# EasyEDA Pro project ProPrj_CactusConKids14_2026-02-14.epro, board CCK14 PCB
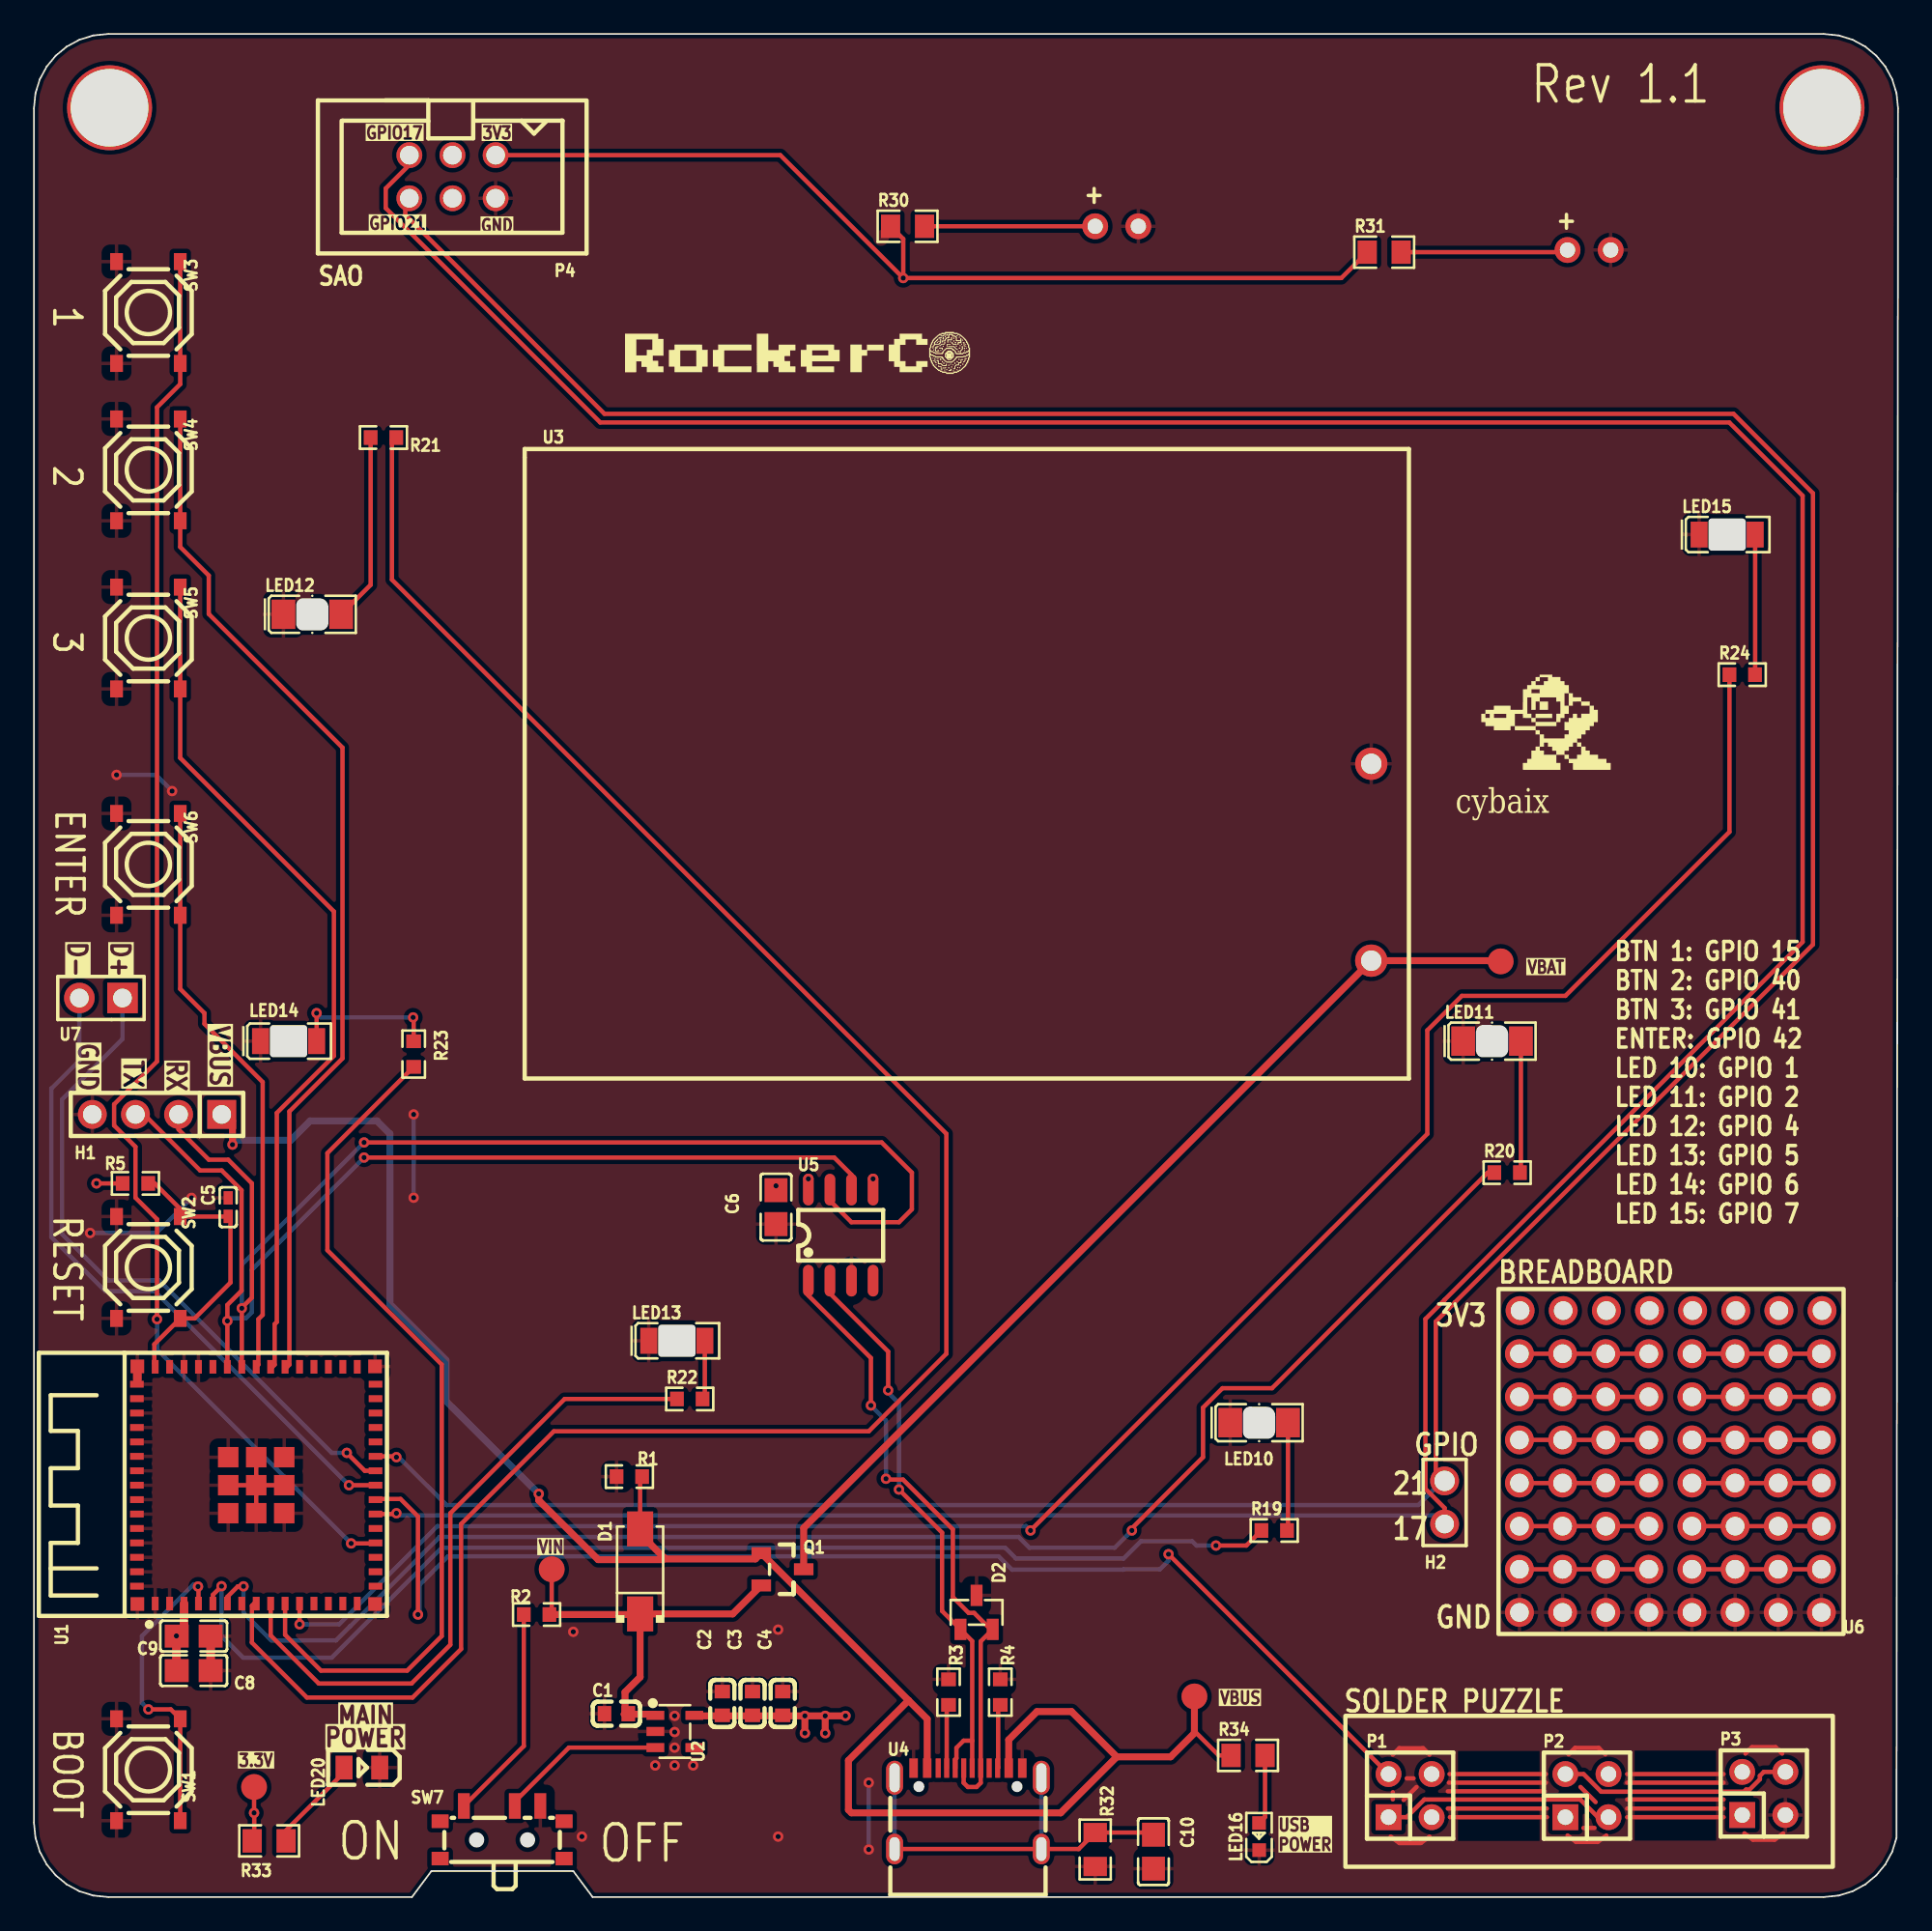
[diagram p5: board, top side]
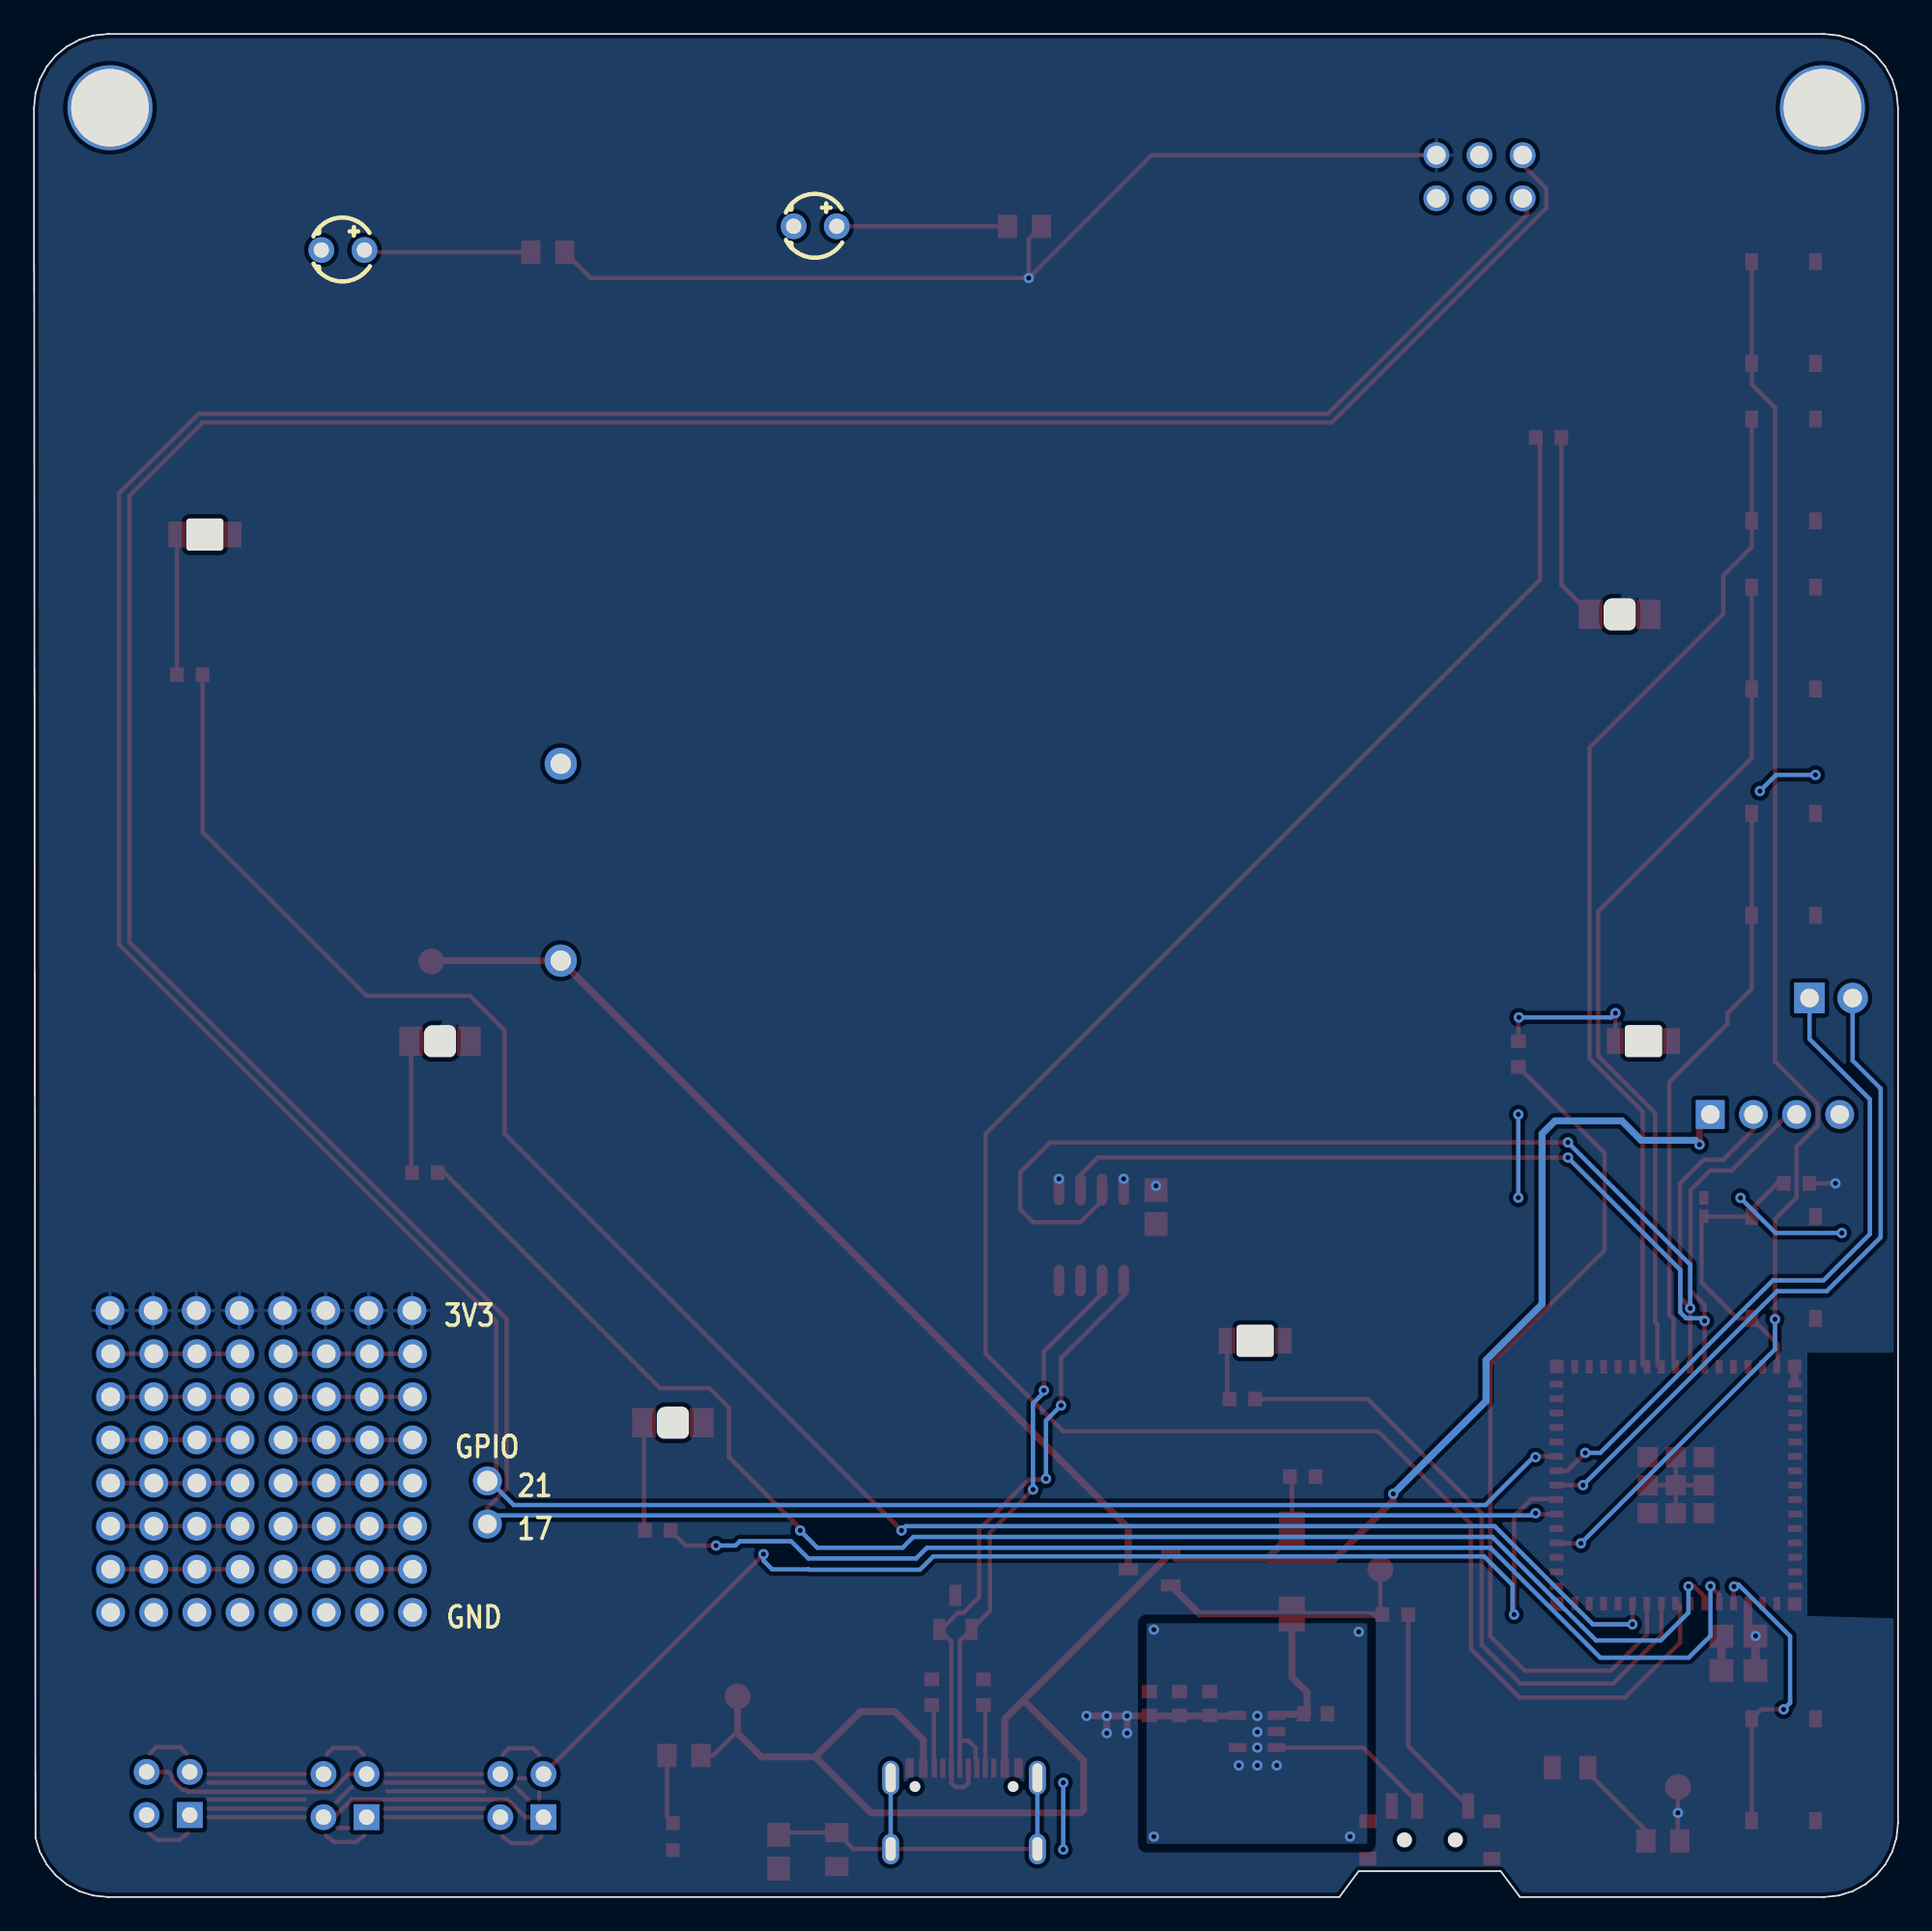
[diagram p6: board, bottom side, seen from below]

Outline 109.77 x 109.76 mm; copper layers: Top Layer, Bottom Layer. Coordinates in mm from the lower left corner of the outline.
Outline path: 0,105.39 0.09,106.27 0.34,107.09 0.75,107.84 1.28,108.48 1.93,109.02 2.67,109.42 3.49,109.67 4.37,109.76 105.39,109.76 106.27,109.67 107.09,109.42 107.84,109.02 108.48,108.48 109.02,107.84 109.42,107.09 109.68,106.27 109.77,105.39 109.68,3.49 109.42,2.67 109.02,1.93 108.48,1.28 107.84,0.75 107.09,0.34 106.27,0.09 105.39,0 32.9,0 31.76,1.53 23.4,1.53 22.26,0 4.37,0 3.49,0.09 2.67,0.34 1.93,0.75 1.28,1.28 0.75,1.93 0.34,2.67 0.09,3.49 0,4.37 0,105.39
Stack: Top Layer 0.035mm / Dielectric1 1.51mm FR4 er 4.5 / Bottom Layer 0.035mm

## Design rules (mm)
template: Custom Config
spacing copperThickness1oz (default): track to track 0.102, other pairs 0.152 to 0.3
spacing copperThickness2oz: track to track 0.203, other pairs 0.152 to 0.3
track width copperThickness1oz (default): min 0.127, default 0.254, max 2.54
track width copperThickness2oz: min 0.203, default 0.254, max 2.54
differential pair differentialPair (default): width min 0.127, default 0.254, max 2.54; gap min 0.152, default 0.152
via viaSize (default): diameter min 0.5, default 0.61, max 10; hole min 0.3, default 0.305, max 6.3
pour e24442 uses copperRegion1

## Placement (name value [footprint] x y rotation side)
C1  10uF  [C0603]  34.3 10.8 0 top
C2  10uF  [C0603]  40.53 11.41 270 top
C3  10uF  [C0603]  42.31 11.41 270 top
C4  10uF  [C0603]  44.09 11.41 270 top
C5  1uF  [C0402]  11.44 40.65 90 top
C6  100nF  [C0805]  43.69 40.65 270 top
C8  4.7uF  [C0805]  9.4 13.34 0 top
C9  100nF  [C0805]  9.4 15.37 0 top
C10  100nF  [C0805]  65.92 2.67 90 top
D1  SK54A-LTP  [SMA_L4.4-W2.8-LS5.4-R-RD]  35.69 19.18 90 top
D2  PESD2USB3UV-TR  [SOT-23-3_L2.9-W1.3-P0.95-LS2.4-BR]  55.51 16.77 270 top
H1  PZ254V-11-04P  [HDR-TH_4P-P2.54-V-M]  7.25 46.11 180 top
H2  PZ254V-11-02P  [HDR-TH_2P-P2.54-V-M]  83.06 23.25 90 top
LED7  TZ-L2-03YYBR2RDJ30-003  [LED-TH_BD3.8-P2.54-RD]  63.76 98.43 180 bottom
LED8  TZ-L2-03YYBR2RDJ30-003  [LED-TH_BD3.8-P2.54-RD]  91.57 97.03 180 bottom
LED10  LTST-C21KRKT  [LED-SMD_L3.2-W1.6-RD-EH_RED]  72.14 27.95 0 top
LED11  LTST-C21KRKT  [LED-SMD_L3.2-W1.6-RD-EH_RED]  85.86 50.43 0 top
LED12  LTST-C21KRKT  [LED-SMD_L3.2-W1.6-RD-EH_RED]  16.39 75.57 0 top
LED13  LTST-C230TBKT  [LED1206-RD_BLUE_LTST-C230TBKT]  37.85 32.77 0 top
LED14  LTST-C230TBKT  [LED1206-RD_BLUE_LTST-C230TBKT]  14.99 50.43 0 top
LED15  LTST-C230TBKT  [LED1206-RD_BLUE_LTST-C230TBKT]  99.7 80.27 0 top
LED16  XL-1608SURC-06  [LED0603-RD_RED]  72.14 3.56 90 top
LED20  KT-0805G  [LED0805-R-RD]  19.31 7.63 180 top
NOREF  -  [Pad_e12518]  30.49 19.31 0 top
NOREF#2  -  [Pad_e8885]  4.45 105.42 0 top
NOREF#3  -  [Pad_e9634]  105.29 105.42 0 top
NOREF#4  -  [Pad_e10780]  68.33 11.82 0 top
NOREF#5  -  [Pad_e10976]  86.37 55.12 0 top
NOREF#6  -  [Pad_e11363]  12.96 6.48 0 top
P1  2.54-2*2P针  [HDR-TH_4P-P2.54-V-M-R2-C2-S2.54-1]  81.03 5.98 0 top
P2  2.54-2*2P针  [HDR-TH_4P-P2.54-V-M-R2-C2-S2.54-1]  91.45 5.98 0 top
P3  2.54-2*2P针  [HDR-TH_4P-P2.54-V-M-R2-C2-S2.54-1]  101.86 6.1 0 top
P4  2.54-2*3P简牛  [IDC-TH_6P-P2.54_C11214]  24.64 101.35 180 top
Q1  DMP2045U-7  [SOT-23-3_L2.9-W1.3-P1.90-LS2.4-BR-CW]  44.08 19.31 180 top
R1  100kΩ  [R0603]  35.06 24.77 180 top
R2  100kΩ  [R0603]  29.6 16.64 180 top
R3  5.1kΩ  [R0603]  53.85 12.07 270 top
R4  5.1kΩ  [R0603]  56.9 12.07 270 top
R5  5.1kΩ  [R0603]  5.98 42.04 180 top
R19  150Ω  [R0603]  73.03 21.6 0 top
R20  150Ω  [R0603]  86.75 42.68 0 top
R21  150Ω  [R0603]  20.58 85.99 180 top
R22  150Ω  [R0603]  38.61 29.34 0 top
R23  150Ω  [R0603]  22.36 49.66 90 top
R24  150Ω  [R0603]  100.59 72.02 0 top
R30  150Ω  [R0805]  51.44 98.43 0 top
R31  150Ω  [R0805]  79.51 96.91 0 top
R32  1MΩ  [R0805]  62.49 2.8 270 top
R33  360Ω  [R0805]  13.85 3.31 0 top
R34  360Ω  [R0805]  71.49 8.35 0 top
SW1  TS-1187A-B-A-B  [SW-SMD_4P-L5.1-W5.1-P3.70-LS6.5-TL_H1.5]  6.74 7.5 270 top
SW2  TS-1187A-B-A-B  [SW-SMD_4P-L5.1-W5.1-P3.70-LS6.5-TL_H1.5]  6.74 37.09 270 top
SW3  TS-1187A-B-A-B  [SW-SMD_4P-L5.1-W5.1-P3.70-LS6.5-TL_H1.5]  6.74 93.35 270 top
SW4  TS-1187A-B-A-B  [SW-SMD_4P-L5.1-W5.1-P3.70-LS6.5-TL_H1.5]  6.74 84.08 270 top
SW5  TS-1187A-B-A-B  [SW-SMD_4P-L5.1-W5.1-P3.70-LS6.5-TL_H1.5]  6.74 74.17 270 top
SW6  TS-1187A-B-A-B  [SW-SMD_4P-L5.1-W5.1-P3.70-LS6.5-TL_H1.5]  6.74 60.84 270 top
SW7  SSSS811101  [SW-SMD_SSSS811101]  27.57 3.82 0 top
U1  2.4GHz  [BULETM-SMD_ESP32-S3-MINI-1-N8]  13.09 24.26 90 top
U2  RT9080-33GJ5  [TSOT-23-5_L2.9-W1.6-P0.95-LS2.8-BL]  37.74 9.76 270 top
U3  BH-AAA-A1AJ024  [BAT-TH_BH-AAA-A1AJ024]  78.75 60.97 0 top
U4  HX TYPE-C 16PIN  [TYPE-C-SMD_HX-TYPE-C-16PIN]  55 5.21 0 top
U5  CH340N  [SOP-8_L4.9-W3.9-P1.27-LS6.0-BL]  47.5 39 0 top
U6  -  [Breadboard 8x8 3V3]  106.31 35.57 180 top
U7  PZ2.54-1*2  [HDR-TH_2P-P2.54-V-M-3]  3.94 52.97 180 top

## Footprints (pads in the part's own frame, mm; a bottom-side part is the same pattern mirrored in y, then rotated)
BAT-TH_BH-AAA-A1AJ024
  round 1.9 hole 1.2: 1(0,5.8) 2(0,-5.8)
Breadboard 8x8 3V3
  round 1.7 hole 1.1: 1(1.016,1.016) 2(3.556,1.016) 3(6.096,1.016) 4(8.636,1.016) 5(11.176,1.016) 6(13.716,1.016) 7(16.256,1.016) 8(18.796,1.016) 9(1.054,3.556) 10(3.594,3.556) 11(6.134,3.556) 12(8.674,3.556) 13(11.214,3.556) 14(13.754,3.556) 15(16.294,3.556) 16(18.834,3.556) 17(1.054,6.096) 18(3.594,6.096) 19(6.134,6.096) 20(8.674,6.096) 21(11.214,6.096) 22(13.754,6.096) 23(16.294,6.096) 24(18.834,6.096) 25(1.054,8.636) 26(3.594,8.636) 27(6.134,8.636) 28(8.674,8.636) 29(11.214,8.636) 30(13.754,8.636) 31(16.294,8.636) 32(18.834,8.636) 33(1.054,11.176) 34(3.594,11.176) 35(6.134,11.176) 36(8.674,11.176) 37(11.214,11.176) 38(13.754,11.176) 39(16.294,11.176) 40(18.834,11.176) 41(1.054,13.716) 42(3.594,13.716) 43(6.134,13.716) 44(8.674,13.716) 45(11.214,13.716) 46(13.754,13.716) 47(16.294,13.716) 48(18.834,13.716) 49(1.054,16.256) 50(3.594,16.256) 51(6.134,16.256) 52(8.674,16.256) 53(11.214,16.256) 54(13.754,16.256) 55(16.294,16.256) 56(18.834,16.256) 57(1.054,18.796) 58(3.594,18.796) 59(6.134,18.796) 60(8.674,18.796) 61(11.214,18.796) 62(13.754,18.796) 63(16.294,18.796) 64(18.834,18.796)
BULETM-SMD_ESP32-S3-MINI-1-N8
  rect 0.8x0.4 smd: 1(-6.975,5.95) 2(-6.975,5.1) 3(-6.975,4.25) 4(-6.975,3.4) 5(-6.975,2.55) 6(-6.975,1.7) 7(-6.975,0.85) 8(-6.975,0) 9(-6.975,-0.85) 10(-6.975,-1.7) 11(-6.975,-2.55) 12(-6.975,-3.4) 13(-6.975,-4.25) 14(-6.975,-5.1) 15(-6.975,-5.95) 31(6.975,-5.95) 32(6.975,-5.1) 33(6.975,-4.25) 34(6.975,-3.4) 35(6.975,-2.55) 36(6.975,-1.7) 37(6.975,-0.85) 38(6.975,0) 39(6.975,0.85) 40(6.975,1.7) 41(6.975,2.55) 42(6.975,3.4) 43(6.975,4.25) 44(6.975,5.1) 45(6.975,5.95)
  rect 0.4x0.8 smd: 16(-5.95,-7.025) 17(-5.1,-7.025) 18(-4.25,-7.025) 19(-3.4,-7.025) 20(-2.55,-7.025) 21(-1.7,-7.025) 22(-0.85,-7.025) 23(0,-7.025) 24(0.85,-7.025) 25(1.7,-7.025) 26(2.55,-7.025) 27(3.4,-7.025) 28(4.25,-7.025) 29(5.1,-7.025) 30(5.95,-7.025) 46(5.95,7.025) 47(5.1,7.025) 48(4.25,7.025) 49(3.4,7.025) 50(2.55,7.025) 51(1.7,7.025) 52(0.85,7.025) 53(0,7.025) 54(-0.85,7.025) 55(-1.7,7.025) 56(-2.55,7.025) 57(-3.4,7.025) 58(-4.25,7.025) 59(-5.1,7.025) 60(-5.95,7.025)
  rect 0.8x0.8 smd: GND(-7,7) GND(-7,-7) GND(7,7) GND(7,-7)
  rect 1.2x1.2 smd: GND(-1.65,1.65) GND(-1.65,0) GND(-1.65,-1.65) GND(0,1.65) GND(0,0) GND(0,-1.65) GND(1.65,1.65) GND(1.65,0) GND(1.65,-1.65)
C0402
  rect 0.79x0.54 smd: 1(-0.545,0) 2(0.545,0)
C0603
  rect 0.8x0.9 smd: 1(-0.7,0) 2(0.7,0)
C0805
  rect 1.41x1.35 smd: 1(-1,0) 2(1,0)
HDR-TH_2P-P2.54-V-M
  round 1.7 hole 1.1: 1(-1.27,0)
  round 1.7 hole 1.2x1.1: 2(1.27,0)
HDR-TH_2P-P2.54-V-M-3
  rect 1.8x1.8 hole 1.1: 1(-1.27,0)
  round 1.8 hole 1.1: 2(1.27,0)
HDR-TH_4P-P2.54-V-M
  rect 1.7x1.7 hole 1.1: 1(-3.81,0)
  round 1.7 hole 1.1: 2(-1.27,0) 3(1.27,0) 4(3.81,0)
HDR-TH_4P-P2.54-V-M-R2-C2-S2.54-1
  rect 1.524x1.524 hole 0.914: 1(-1.27,-1.27)
  round 1.524 hole 0.914: 2(-1.27,1.27) 3(1.27,-1.27) 4(1.27,1.27)
IDC-TH_6P-P2.54_C11214
  round 1.524 hole 1.1: 1(-2.54,-1.27) 2(-2.54,1.27) 3(0,-1.27) 4(0,1.27) 5(2.54,-1.27) 6(2.54,1.27)
LED0603-RD_RED
  rect 0.8x0.8 smd: 1(-0.799,-0.004) 2(0.799,0.004)
LED0805-R-RD
  rect 1x1.399 smd: 1(1.05,0) 2(-1.05,0)
LED1206-RD_BLUE_LTST-C230TBKT
  rect 1x1.524 smd: 1(-1.651,0) 2(1.651,0)
LED-SMD_L3.2-W1.6-RD-EH_RED
  rect 1.4x1.728 smd: 1(-1.7,0) 2(1.7,0)
LED-TH_BD3.8-P2.54-RD
  round 1.524 hole 0.9: 1(-1.27,0) 2(1.27,0)
Pad_e8885
  round 5.004 hole 4.572: (0,0)
Pad_e9634
  round 5.004 hole 4.572: (0,0)
Pad_e10780
  round 1.524 smd: 1(0,0)
Pad_e10976
  round 1.524 smd: 1(0,0)
Pad_e11363
  round 1.524 smd: 1(0,0)
Pad_e12518
  round 1.524 smd: 1(0,0)
R0603
  rect 0.806x0.864 smd: 1(-0.753,0) 2(0.753,0)
R0805
  rect 1.133x1.377 smd: 1(-1,0) 2(1,0)
SMA_L4.4-W2.8-LS5.4-R-RD
  rect 2.062x1.539 smd: 1(2.503,0) 2(-2.503,0)
SOP-8_L4.9-W3.9-P1.27-LS6.0-BL
  oval 0.63x1.865 smd: 1(-1.905,-2.683) 2(-0.635,-2.683) 3(0.635,-2.683) 4(1.905,-2.683) 5(1.905,2.683) 6(0.635,2.683) 7(-0.635,2.683) 8(-1.905,2.683)
SOT-23-3_L2.9-W1.3-P0.95-LS2.4-BR
  rect 1.25x0.7 smd: 1(1,-0.95) 2(1,0.95) 3(-1,0)
SOT-23-3_L2.9-W1.3-P1.90-LS2.4-BR-CW
  rect 1.15x0.7 smd: 1(1.25,-0.95) 2(-1.25,0) 3(1.25,0.95)
SW-SMD_4P-L5.1-W5.1-P3.70-LS6.5-TL_H1.5
  rect 1x0.75 smd: 1(-3,1.875) 2(3,1.875) 3(-3,-1.875) 4(3,-1.875)
SW-SMD_SSSS811101
  rect 0.7x1.5 smd: 1(-2.25,1.55) 2(0.75,1.55) 3(2.25,1.55)
  rect 1x0.8 smd: 4(-3.65,0.65) 5(3.65,0.65) 6(3.65,-1.55) 7(-3.65,-1.55)
TSOT-23-5_L2.9-W1.6-P0.95-LS2.8-BL
  rect 0.532x1.045 smd: 1(-0.95,-1.147) 2(0,-1.147) 3(0.95,-1.147) 4(0.95,1.147) 5(-0.95,1.147)
TYPE-C-SMD_HX-TYPE-C-16PIN
  oval 1x2 hole 0.6x1.7: 17(-4.32,1.816) 20(4.32,1.816)
  oval 1x1.8 hole 0.6x1.4: 18(-4.32,-2.384) 19(4.32,-2.384)
  rect 0.3x1.14 smd: A5(-1.25,2.383) A6(-0.25,2.383) A7(0.25,2.383) A8(1.25,2.384) B5(1.75,2.383) B6(0.75,2.383) B7(-0.75,2.383) B8(-1.75,2.384)
  rect 0.5x1.14 smd: A9B4(2.4,2.384) A12B1(3.2,2.384) B9A4(-2.4,2.384) B12A1(-3.2,2.384)

## Nets
As in the schematic, except:
3.3V: C2.2 C3.2 C4.2 C6.1 C8.1 C9.1 NOREF#6.1 P4.1 R5.2 R30.1 R31.1 R33.1 U1.3 U2.5 U5.5 U5.8 U6.1 U6.2 U6.3 U6.4 U6.5 U6.6 U6.7 U6.8
VBAT: NOREF#5.1 Q1.2 U3.2
VBUS: D1.1 H1.1 NOREF#4.1 Q1.1 R1.1 R34.1 U4.A9B4 U4.B9A4
VIN: C1.2 D1.2 NOREF.1 Q1.3 R2.1 U2.1

Pads without a net: P1 3 4; P2 1 4; P3 1 2; P4 3 4; SW7 4 5 6 7; U1 7 12 13 14 15 16 17 18 20 26 27 28 29 30 31 32 33 34 35 41 44; U2 4; U4 A8 B8; U5 4

## Via types
v1: diameter 0.61, hole 0.305, Top Layer to Bottom Layer, 58 vias

## Routing (per net, layer and track width the routed paths; a pad name or vN(x,y) marks a point on that pad's centre or on a via; arc(x,y) is an arc through that point)
3.3V: length 77.5
  Top Layer w0.254: R30.1 51.19,97.69 v1(51.19,95.38) ; NOREF#6.1 v1(12.96,4.96) 12.97,4.95 12.97,3.56 ; v1(3.68,42.04) R5.2 ; P4.1 43.95,102.62 v1(51.19,95.38) ; v1(51.19,95.38) 76.98,95.38 R31.1
  Top Layer w0.406: v1(45.4,10.67) v1(45.4,9.66) ; v1(45.4,10.67) v1(46.59,10.67) ; v1(45.4,10.67) 38.92,10.67 U2.5 ; v1(46.59,10.67) v1(46.59,9.65) ; v1(46.59,10.67) v1(47.79,10.67)
  Top Layer w0.508: 8.53,13.72 8.39,13.87 v1(8.39,15.39) 8.84,15.84 U1.3
  vias: v1(43.69,41.9) v1(45.6,42.31) v1(49.41,42.31)
GND: length 103.4
  Top Layer w0.254: 79.89,3.56 80.4,3.18 81.67,3.18 82.18,3.56 ; 80.02,8.39 80.4,8.77 81.79,8.77 82.18,8.39 ; 80.02,6.17 80.02,5.76 ; 80.65,5.72 81.41,6.48 ; 80.83,6.99 81.23,6.99 ; 83.26,6.23 88.97,6.23 ; 83.26,5.21 89.08,5.21 ; 83.32,6.74 89.03,6.74 ; 83.36,7.25 89.03,7.25 ; 83.38,4.71 89.09,4.71 ; 90.3,3.63 90.81,3.25 92.08,3.25 92.59,3.63 ; 90.37,8.41 90.75,8.79 92.14,8.79 92.53,8.41 ; 91.89,4.07 91.24,4.07 ; 93.82,7.25 99.49,7.25 ; 93.82,6.74 99.49,6.74 ; 93.82,5.75 99.49,5.75 ; 93.82,5.21 99.49,5.21 ; 93.82,4.71 99.49,4.71 ; 100.72,3.75 101.23,3.37 102.5,3.37 103,3.75 ; 100.78,8.45 101.16,8.83 102.56,8.83 102.94,8.45 ; U1.GND U1.GND ; U1.GND U1.GND ; U1.GND U1.GND ; U1.GND U1.GND
  Top Layer w0.508: 6.09,30.49 U1.GND ; C9.2 C8.2
  Bottom Layer w0.254: v1(9.28,41.19) 7.21,39.12 v1(3.31,39.12) ; v1(8.13,65.16) 7.18,66.11 v1(4.86,66.11) ; v1(22.36,46.11) v1(22.36,41.2) ; v1(49.16,6.74) v1(49.16,2.8)
  vias: v1(31.76,15.63) v1(32.26,3.56) v1(36.58,7.75) v1(37.73,10.67) v1(37.73,9.72) v1(37.73,8.8) v1(37.73,7.75) v1(38.82,7.75) v1(43.82,15.75) v1(43.82,3.56)
VBAT: length 57.4
  Top Layer w0.406: NOREF#5.1 86.37,55.17 U3.2 45.33,21.75 Q1.2
VBUS: length 119.7
  Top Layer w0.254: D1.1 35.69,24.65 R1.1 ; R34.1 69.77,8.35 68.33,9.78
  Top Layer w0.406: v1(29.72,23.76) 29.72,23.38 33.22,19.88 37.02,19.88 37.12,19.98 ; 51.5,11.59 47.96,8.05 47.96,5.14 48.14,4.96 60.46,4.96 63.76,8.26 ; 51.5,11.59 52.6,10.49 U4.B9A4 ; 51.5,11.59 Q1.1 42.49,19.92 37.12,19.92 37.12,19.98 ; 11.06,46.36 11.69,45.73 v1(11.69,44.33) ; U4.A9B4 57.4,9.26 59.06,10.93 61.09,10.93 63.76,8.26 ; NOREF#4.1 68.33,9.66 66.94,8.26 63.76,8.26 ; 37.12,19.98 35.69,21.4 D1.1
  Bottom Layer w0.406: v1(29.72,23.76) 24.26,29.22 24.26,31.63 20.96,34.93 20.96,44.96 20.2,45.73 16.26,45.73 15.12,44.58 11.94,44.58 v1(11.69,44.33)
VIN: length 24.1
  Top Layer w0.254: NOREF.1 30.49,16.78 R2.1
  Top Layer w0.406: R2.1 35.66,16.64 D1.2 ; D1.2 35.69,12.96 34.8,12.07 34.8,10.82 34.76,10.77 36.53,10.77 U2.1 ; D1.2 41.14,16.68 Q1.3
BOOT: length 18.2
  Top Layer w0.254: U1.4 9.69,18.27 v1(9.66,18.29) ; v1(6.74,11.06) 8.06,11.06 SW1.1 SW1.2
  Bottom Layer w0.254: v1(9.66,18.29) 9.53,18.42 9.4,18.42 6.36,15.37 6.36,11.44 v1(6.74,11.06)
BUTTON1: length 84.4
  Top Layer w0.254: v1(7.25,34.04) 7.25,39.93 5.98,41.2 5.98,44.2 4.72,45.46 4.72,46.7 7.25,49.23 7.25,87.76 8.61,89.13 SW3.2 SW3.1 ; U1.19 20.08,20.84 v1(18.68,20.84)
  Bottom Layer w0.254: v1(18.68,20.84) 7.25,32.27 v1(7.25,34.04)
BUTTON2: length 61.3
  Top Layer w0.254: SW4.1 SW4.2 8.61,79.54 10.29,77.86 10.29,75.59 18.17,67.72 18.17,49.41 15.04,46.28 15.04,31.37 14.91,31.24 14.79,31.24
BUTTON3: length 51.3
  Top Layer w0.254: 13.94,31.24 14.05,31.24 14.17,31.37 14.17,33.75 14.3,33.88 14.3,46.2 17.66,49.56 17.66,58.06 8.61,67.11 SW5.1
BUTTON4: length 34.8
  Top Layer w0.254: 13.09,31.24 13.21,31.37 13.21,34.04 13.47,34.3 13.47,48.01 10.04,51.44 10.04,52.07 8.61,53.5 SW6.2 SW6.1
CC1: length 3.8
  Top Layer w0.254: U4.A5 53.75,11.21 R3.2
CC2: length 3.8
  Top Layer w0.254: U4.B5 56.78,7.62 56.78,11.19 R4.2
D+: length 37.3
  Top Layer w0.254: v1(50.17,24.64) 50.22,24.59 51.18,24.59 54.11,21.66 54.11,17.67 55.04,16.74 55.36,16.74 56.33,15.77 D2.2 55.75,15.06 U4.B6 55.75,6.73 55.5,6.48 54.99,6.48 54.74,6.73 54.74,7.59 U4.A6 ; U5.1 45.6,35.44 49.28,31.76 v1(49.28,28.96)
  Bottom Layer w0.254: v1(49.28,28.96) 50.17,28.07 v1(50.17,24.64)
D-: length 34.5
  Top Layer w0.254: v1(50.3,29.85) 50.3,32.14 46.87,35.57 U5.2 ; 55.25,9.21 U4.A7 ; 55.25,9.21 55.25,15.08 D2.1 53.47,16.85 53.47,21.47 v1(50.93,24.01) ; 55.25,9.21 54.74,9.21 54.32,8.79 54.32,8.18 54.25,8.1 U4.B7
  Bottom Layer w0.254: v1(50.3,29.85) 50.3,29.72 50.93,29.09 v1(50.93,24.01)
EN: length 9.8
  Top Layer w0.254: U2.3 31.5,8.81 28.32,5.62 28.32,5.37
GPIO17: length 227.6
  Top Layer w0.254: H2.1 83.06,22.92 81.94,24.05 81.94,34.05 83.06,35.18 83.06,35.19 104.15,56.27 104.15,82.56 99.83,86.88 33.34,86.88 20.71,99.5 20.71,100.66 22.1,102.05 P4.5 ; U1.21 21.29,22.56 v1(21.34,22.61)
  Bottom Layer w0.254: H2.1 82.56,22.49 21.47,22.49 v1(21.34,22.61)
GPIO18: length 74.6
  Top Layer w0.254: U1.22 20.15,23.45 21.58,23.45 22.61,22.42 v1(22.61,16.64) ; v1(66.81,20.2) P1.2
  Bottom Layer w0.254: v1(22.61,16.64) 22.7,16.73 22.7,18.39 24.38,20.07 56.81,20.07 57.59,19.28 64.13,19.28 64.16,19.31 66.3,19.31 66.81,19.82 v1(66.81,20.2)
GPIO21: length 223.1
  Top Layer w0.254: v1(21.34,25.91) 21.29,25.96 U1.25 ; P4.6 22.1,99.94 21.86,99.7 21.86,99.11 33.59,87.38 100.08,87.38 104.76,82.7 104.76,56.12 83.67,35.04 83.67,35.03 82.55,33.91 82.55,25.04 H2.2
  Bottom Layer w0.254: H2.2 82.94,24.52 81.52,23.1 24.29,23.1 21.47,25.91 v1(21.34,25.91)
LED1: length 69.8
  Top Layer w0.254: R19.1 71.39,20.71 v1(69.6,20.71) ; U1.5 10.54,17.81 v1(11.04,18.31)
  Bottom Layer w0.254: v1(11.04,18.31) 11.04,15.38 12.33,14.1 17.53,14.1 24.01,20.58 57.18,20.58 57.82,19.95 64.16,19.95 65.18,20.96 68.21,20.96 68.46,20.71 v1(69.6,20.71)
LED2: length 91.2
  Top Layer w0.254: v1(12.34,18.31) 12.01,18.31 11.39,17.69 U1.6 ; v1(64.65,21.6) 64.65,21.72 68.84,25.91 68.84,28.84 69.98,29.98 72.9,29.98 85.6,42.68 R20.1
  Bottom Layer w0.254: v1(12.34,18.31) 12.34,16.76 13.98,15.12 17.78,15.12 18.61,15.94 18.61,15.94 23.88,21.22 57.98,21.22 58.62,20.58 63.63,20.58 v1(64.65,21.6)
LED3: length 125.1
  Top Layer w0.254: U1.8 12.96,17.29 12.83,17.16 12.83,14.99 16.07,11.75 22.3,11.75 25.15,14.61 25.15,21.98 30.61,27.44 49.16,27.44 53.73,32.01 53.73,44.96 21.08,77.61 21.08,85.86 21.21,85.99 R21.1
LED4: length 38.5
  Top Layer w0.254: U1.9 13.94,15.41 16.77,12.58 22.23,12.58 24.52,14.87 24.52,22.61 31.25,29.34 R22.1
LED5: length 51.2
  Top Layer w0.254: R23.1 17.28,43.83 17.28,38.11 24.01,31.38 24.01,15.37 21.98,13.34 16.9,13.34 14.79,15.45 U1.10
LED6: length 117.8
  Top Layer w0.254: R24.1 99.84,62.75 90.18,53.09 84.08,53.09 82.05,51.06 82.05,44.96 v1(58.68,21.6) ; U1.11 15.64,16.07 v1(15.64,16.07)
  Bottom Layer w0.254: v1(58.68,21.6) 58.43,21.85 23.76,21.85 17.98,16.07 v1(15.64,16.07)
RESET: length 17
  Top Layer w0.254: R5.1 7.11,42.04 8.61,40.54 SW2.1 11.43,40.09 C5.1 11.57,39.97 11.57,36.2 9.46,34.09 SW2.2 7.09,32.57 7.09,31.41 7.14,31.37
RX: length 72.1
  Top Layer w0.254: 8.52,46.36 8.52,45.22 10.29,43.44 11.44,43.44 12.83,42.04 12.83,35.31 12.36,34.84 12.36,34.81 v1(12.24,34.69) 12.24,31.24 ; U5.7 46.87,41.03 48.14,39.76 50.93,39.76 51.7,40.52 51.7,42.68 49.92,44.46 v1(19.44,44.46)
  Bottom Layer w0.254: v1(12.24,34.69) 12.24,37.26 v1(19.44,44.46)
S3_D+: length 39.6
  Top Layer w0.254: v1(18.42,26.17) 19.48,25.11 U1.24
  Bottom Layer w0.254: v1(18.42,26.17) 17.53,26.17 7.37,36.33 4.39,36.33 1.66,39.06 1.66,47 5.21,50.55 U7.1
S3_D-: length 39.9
  Top Layer w0.254: v1(18.55,24.26) U1.23
  Bottom Layer w0.254: v1(18.55,24.26) 7.12,35.69 4.2,35.69 1.02,38.87 1.02,47.63 2.67,49.28 U7.2
TX: length 62.5
  Top Layer w0.254: U5.6 48.14,42.55 47.12,43.57 v1(19.44,43.57) ; 11.39,31.24 v1(11.39,33.94) 11.39,34.88 12.22,35.72 12.22,41.64 11.06,42.81 9.79,42.81 6.74,45.85 6.48,45.85 5.98,46.36
  Bottom Layer w0.254: v1(11.39,33.94) 11.55,34.1 12.48,34.1 12.82,34.45 12.82,36.95 v1(19.44,43.57)
$1N5519: length 12.7
  Top Layer w0.254: 25.32,5.37 28.84,8.9 R2.2
$1N10299: length 24.1
  Top Layer w0.254: C10.2 65.79,3.8 R32.1 61.52,2.83 U4.19 U4.18
  Bottom Layer w0.254: U4.17 U4.18 ; U4.20 U4.19
$2N3582: length 10
  Top Layer w0.254: R30.2 LED7.2
$2N3586: length 9.8
  Top Layer w0.254: LED8.2 90.18,96.91 R31.2
$2N10665: length 6.4
  Top Layer w0.254: R19.2 73.84,21.65 LED10.2
$2N10669: length 7.8
  Top Layer w0.254: 87.37,42.68 87.56,42.86 LED11.2
$2N10674: length 11.1
  Top Layer w0.254: LED12.2 19.83,77.31 R21.2
$2N10679: length 3.5
  Top Layer w0.254: LED13.2 39.5,29.48 R22.2
$2N10684: length 8.9
  Top Layer w0.254: R23.2 22.36,51.79 v1(22.33,51.82) ; v1(16.64,52.08) LED14.2
  Bottom Layer w0.254: v1(16.64,52.08) 16.9,51.82 v1(22.33,51.82)
$2N10689: length 8.3
  Top Layer w0.254: R24.2 101.35,72.02 LED15.2
$2N11230: length 4.1
  Top Layer w0.254: LED16.2 72.49,4.71 R34.2
$2N11275: length 6.3
  Top Layer w0.254: LED20.1 18.49,7.85 18.49,7.57 14.48,3.56
$3N280: length 7.9
  Top Layer w0.254: 87.22,26.93 U6.31 U6.29
$3N284: length 7.9
  Top Layer w0.254: 97.38,26.93 U6.26 U6.25
$3N297: length 7.9
  Top Layer w0.254: 87.22,19.31 U6.55 U6.53
$3N301: length 7.9
  Top Layer w0.254: U6.49 U6.50 97.38,19.31
$3N305: length 7.9
  Top Layer w0.254: U6.37 U6.39 87.22,24.39
$3N309: length 7.6
  Top Layer w0.254: U6.41 U6.42 U6.44
$3N313: length 7.9
  Top Layer w0.254: U6.45 U6.47 87.22,21.85
$3N317: length 7.9
  Top Layer w0.254: 97.38,24.39 U6.34 U6.33
$3N331: length 7.6
  Top Layer w0.254: U6.21 U6.23 U6.24
$3N335: length 7.6
  Top Layer w0.254: U6.16 U6.15 U6.13
$3N339: length 7.6
  Top Layer w0.254: U6.20 U6.18 U6.17
$3N343: length 7.6
  Top Layer w0.254: U6.9 U6.10 U6.12
$3N824: length 13.8
  Top Layer w0.254: P1.1 80.83,4.71 81.87,5.75 91.05,5.75 92.1,4.71 P2.3
$3N833: length 14
  Top Layer w0.254: P3.4 101.86,7.37 101.63,7.14 101.63,6.94 101.02,6.33 100.82,6.33 100.69,6.2 92.29,6.2 91.24,7.25 P2.2

## Copper pours and planes (outline as drawn; the poured copper is in the pictures)
3.3V on Bottom Layer: 105.52,0 4.5,0 3.62,0.09 2.8,0.34 2.06,0.75 1.41,1.28 0.87,1.93 0.47,2.67 0.22,3.49 0.13,4.37 0.13,16.42 5.34,16.56 5.34,32.06 0.13,32.06 0.13,105.39 0.22,106.27 0.47,107.09 0.87,107.84 1.41,108.48 2.06,109.02 2.8,109.42 3.62,109.67 4.5,109.76 105.52,109.76 106.4,109.67 107.22,109.42 107.96,109.02 108.61,108.48 109.14,107.84 109.55,107.09 109.8,106.27 109.89,105.39 109.89,4.37 109.8,3.49 109.55,2.67 109.14,1.93 108.61,1.28 107.96,0.75 107.22,0.34 106.4,0.09
GND on Top Layer: 105.52,0 4.5,0 3.62,0.09 2.8,0.34 2.06,0.75 1.41,1.28 0.87,1.93 0.47,2.67 0.22,3.49 0.13,4.37 0.13,16.43 5.32,16.43 5.32,32.2 0.13,32.2 0.13,105.39 0.22,106.27 0.47,107.09 0.87,107.84 1.41,108.48 2.06,109.02 2.8,109.42 3.62,109.67 4.5,109.76 105.52,109.76 106.4,109.67 107.22,109.42 107.96,109.02 108.61,108.48 109.14,107.84 109.55,107.09 109.8,106.27 109.89,105.39 109.89,4.37 109.8,3.49 109.55,2.67 109.14,1.93 108.61,1.28 107.96,0.75 107.22,0.34 106.4,0.09
GND on Bottom Layer: 31.25,16.14 44.25,16.14 44.25,3.13 31.25,3.13

## Text on the board
Bottom Silkscreen Layer: 21 | 17 | GPIO | GND | 3V3
Top Silkscreen Layer: 3.3V | GPIO17 | GPIO21 | GND | 3V3 | VIN | VBUS | USB / POWER | VBAT | D- | D+ | TX | RX | SAO | POWER | MAIN | + | BTN 1: GPIO 15 / BTN 2: GPIO 40 / BTN 3: GPIO 41 / ENTER: GPIO 42 / LED 10: GPIO 1 / LED 11: GPIO 2 / LED 12: GPIO 4 / LED 13: GPIO 5 / LED 14: GPIO 6 / LED 15: GPIO 7 | SOLDER PUZZLE | 21 | 17 | GPIO | BREADBOARD | 1 | 2 | 3 | RESET | BOOT | ENTER | ON | OFF | Rev 1.1 | cybaix
